# Altium schematic sheet LORAPROJ_1.SchDoc
size A; SheetNumber: 1; SheetTotal: 3
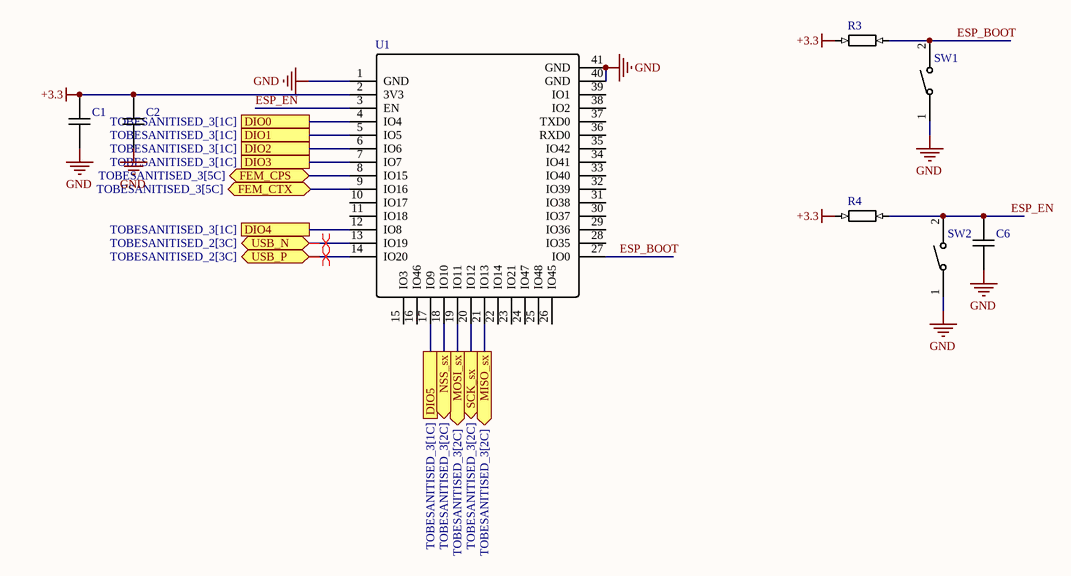
[diagram p0: LORAPROJ_1.SchDoc]

## Parts
C1  (no value)  [CAP_0603]
C2  (no value)  [CAP_0603]
C6  (no value)  [CAP_0603]
R3  (no value)  [RES_0603]
R4  (no value)  [RES_0603]
SW1  (no value)  [SW_SMD_3.9x3.0]
SW2  (no value)  [SW_SMD_3.9x3.0]
U1  (no value)  [RF_MODULE_SMD]

## Ports
DIO0 (see TOBESANITISED_3[1C]), DIO1 (see TOBESANITISED_3[1C]), DIO2 (see TOBESANITISED_3[1C]), DIO3 (see TOBESANITISED_3[1C]), DIO4 (see TOBESANITISED_3[1C]), DIO5 (see TOBESANITISED_3[1C]), FEM_CPS (bidir, see TOBESANITISED_3[5C]), FEM_CTX (bidir, see TOBESANITISED_3[5C]), MISO_sx (out, see TOBESANITISED_3[2C]), MOSI_sx (out, see TOBESANITISED_3[2C]), NSS_sx (out, see TOBESANITISED_3[2C]), SCK_sx (out, see TOBESANITISED_3[2C]), USB_N (bidir, see TOBESANITISED_2[3C]), USB_P (bidir, see TOBESANITISED_2[3C])

## Nets
+3.3: C1.2 C2.2 R3.1 R4.1 U1.2(3V3)
GND: C1.1 C2.1 C6.1 SW1.1 SW2.1 U1.1(GND) U1.40(GND) U1.41(GND)
DIO0: U1.4(IO4) ; port DIO0
DIO1: U1.5(IO5) ; port DIO1
DIO2: U1.6(IO6) ; port DIO2
DIO3: U1.7(IO7) ; port DIO3
DIO4: U1.12(IO8) ; port DIO4
DIO5: U1.17(IO9) ; port DIO5
ESP_BOOT: R3.2 SW1.2 U1.27(IO0)
ESP_EN: C6.2 R4.2 SW2.2 U1.3(EN)
FEM_CPS: U1.8(IO15) ; port FEM_CPS
FEM_CTX: U1.9(IO16) ; port FEM_CTX
MISO_sx: U1.21(IO13) ; port MISO_sx
MOSI_sx: U1.19(IO11) ; port MOSI_sx
NSS_sx: U1.18(IO10) ; port NSS_sx
SCK_sx: U1.20(IO12) ; port SCK_sx
USB_N: U1.13(IO19) ; port USB_N
USB_P: U1.14(IO20) ; port USB_P

Not connected (* = marked no-connect by the designer): U1 10(IO17) 11(IO18) 15(IO3) 16(IO46) 22(IO14) 23(IO21) 24(IO47) 25(IO48) 26(IO45) 28(IO35) 29(IO36) 30(IO37) 31(IO38) 32(IO39) 33(IO40) 34(IO41) 35(IO42) 36(RXD0) 37(TXD0) 38(IO2) 39(IO1)

## Layout directives
differential pair: USB_N, USB_P

## Library data of the parts
C1 C2 C6 = CAP: Package: CAP_0603
R3 R4 = RES: Package: RES_0603
SW1 SW2 = SW: Package: SW_SMD_3.9x3.0
U1 = IC_U1: Package: RF_MODULE_SMD